# Altium schematic sheet speed-and-rpm.SchDoc
size A4; SheetNumber: 9; SheetTotal: 15
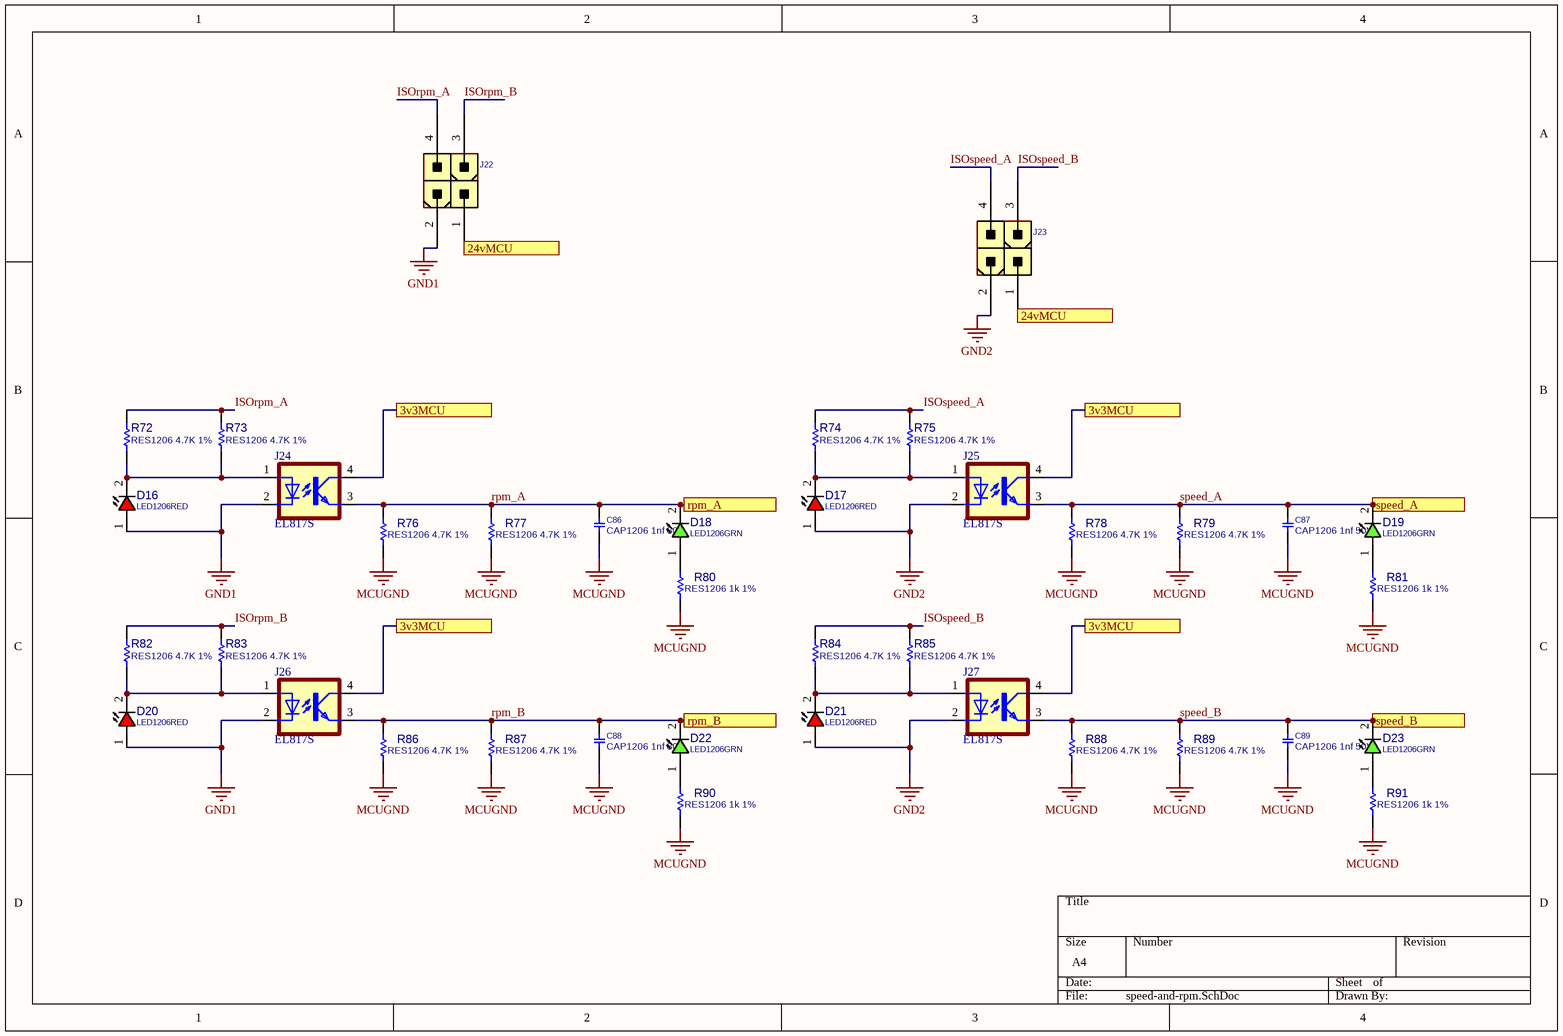
[diagram p0: speed-and-rpm.SchDoc]

## Parts
C86  CAP1206 1nf 50V  [C1206]
C87  CAP1206 1nf 50V  [C1206]
C88  CAP1206 1nf 50V  [C1206]
C89  CAP1206 1nf 50V  [C1206]
D16  LED1206RED  [LED1206RED]
D17  LED1206RED  [LED1206RED]
D18  LED1206GRN  [LED1206GRN]
D19  LED1206GRN  [LED1206GRN]
D20  LED1206RED  [LED1206RED]
D21  LED1206RED  [LED1206RED]
D22  LED1206GRN  [LED1206GRN]
D23  LED1206GRN  [LED1206GRN]
J22  CONN_ATXPWR_4  [ATXPWR_4]  (value not drawn)
J23  CONN_ATXPWR_4  [ATXPWR_4]  (value not drawn)
J24  EL817S  [SOIC254P1030X460-4N]
J25  EL817S  [SOIC254P1030X460-4N]
J26  EL817S  [SOIC254P1030X460-4N]
J27  EL817S  [SOIC254P1030X460-4N]
R72  RES1206 4.7K 1%  [R1206]
R73  RES1206 4.7K 1%  [R1206]
R74  RES1206 4.7K 1%  [R1206]
R75  RES1206 4.7K 1%  [R1206]
R76  RES1206 4.7K 1%  [R1206]
R77  RES1206 4.7K 1%  [R1206]
R78  RES1206 4.7K 1%  [R1206]
R79  RES1206 4.7K 1%  [R1206]
R80  RES1206 1k 1%  [R1206]
R81  RES1206 1k 1%  [R1206]
R82  RES1206 4.7K 1%  [R1206]
R83  RES1206 4.7K 1%  [R1206]
R84  RES1206 4.7K 1%  [R1206]
R85  RES1206 4.7K 1%  [R1206]
R86  RES1206 4.7K 1%  [R1206]
R87  RES1206 4.7K 1%  [R1206]
R88  RES1206 4.7K 1%  [R1206]
R89  RES1206 4.7K 1%  [R1206]
R90  RES1206 1k 1%  [R1206]
R91  RES1206 1k 1%  [R1206]

## Ports
3v3MCU, 24vMCU, rpm_A, rpm_B, speed_A, speed_B

## Nets
GND1: D16.1(ANODE) D20.1(ANODE) J22.2 J24.2(C) J26.2(C)
GND2: D17.1(ANODE) D21.1(ANODE) J23.2 J25.2(C) J27.2(C)
MCUGND: C86.2 C87.2 C88.2 C89.2 R76.1 R77.1 R78.1 R79.1 R80.1 R81.1 R86.1 R87.1 R88.1 R89.1 R90.1 R91.1
3v3MCU: J24.4(COL) J25.4(COL) J26.4(COL) J27.4(COL) ; port 3v3MCU
24vMCU: J22.1 J23.1 ; port 24vMCU
ISOrpm_A: J22.4 R72.2 R73.2
ISOrpm_B: J22.3 R82.2 R83.2
ISOspeed_A: J23.4 R74.2 R75.2
ISOspeed_B: J23.3 R84.2 R85.2
rpm_A: C86.1 D18.2(CATHODE) J24.3(EMIT) R76.2 R77.2 ; port rpm_A
rpm_B: C88.1 D22.2(CATHODE) J26.3(EMIT) R86.2 R87.2 ; port rpm_B
speed_A: C87.1 D19.2(CATHODE) J25.3(EMIT) R78.2 R79.2 ; port speed_A
speed_B: C89.1 D23.2(CATHODE) J27.3(EMIT) R88.2 R89.2 ; port speed_B
NetD16_2: D16.2(CATHODE) J24.1(A) R72.1 R73.1
NetD17_2: D17.2(CATHODE) J25.1(A) R74.1 R75.1
NetD18_1: D18.1(ANODE) R80.2
NetD19_1: D19.1(ANODE) R81.2
NetD20_2: D20.2(CATHODE) J26.1(A) R82.1 R83.1
NetD21_2: D21.2(CATHODE) J27.1(A) R84.1 R85.1
NetD22_1: D22.1(ANODE) R90.2
NetD23_1: D23.1(ANODE) R91.2

## Library data of the parts
C86-C89 = CAP_SMD_MLCC_1206: CAP, MLCC; PARAM: -, -%; MANF_P#: MANF_PART#; PARAM2: -V; PRICE: 100= 1$; MANF: -; ASSEMBLY: ASSEMBLY
D16 D17 D20 D21 = LED_SMD_1206_RED: LED, SMD, 1206, RED; DESC: DESCRIPTION; MANF_P#: MANF_PART#; PARAM2: 1.7~2.4V; MANF: MANF; ASSEMBLY: ASSEMBLY; PRICE: 36t@Javan; VALUE: LED1206RED; MountType: SMT; PartType: LED
D18 D19 D22 D23 = LED_SMD_1206_GRN: LED, SMD, 1206, GREEN; PARAM: 20mA; DESC: DESCRIPTION; PARAM2: 2.2V; MANF: -; ASSEMBLY: ASSEMBLY; PRICE: 36t@Javan; MANF_P#: -; VALUE: LED1206GRN; MountType: SMT; PartType: LED
J22 J23 = CONN_ATXPWR_4: CONN, ATX POWER, 4 P; MANF: TE, Molex; MANF_P#: 4-1775099-0, 39281043; VALUE: CONN_ATXPWR_4; MountType: THD; PACKAGE: ATXPWR-4pin; Part Type: Conn.
J24-J27 = EL817S: Optoisolator Transistor Output 5000Vrms 1 Channel 4-SMD; MF: Everlight Electronics; SnapEDA_Link: https://www.snapeda.com/parts/EL817S/Everlight+Electronics+Co+Ltd/view-part/?ref=snap; Package: SMD-4 Everlight Electronics Co Ltd; Value: *; MP: EL817S; Check_prices: https://www.snapeda.com/parts/EL817S/Everlight+Electronics+Co+Ltd/view-part/?ref=eda
R72-R91 = RES_SMD_1206: RESISTOR, SMD; PARAM: 1%, 0.25W; DESC: DESCRIPTION; DIST#: MOUSER; MANF_P#: -; MANF: -; ASSEMBLY: ASSEMBLY; PRICE: -; PARAM2: -